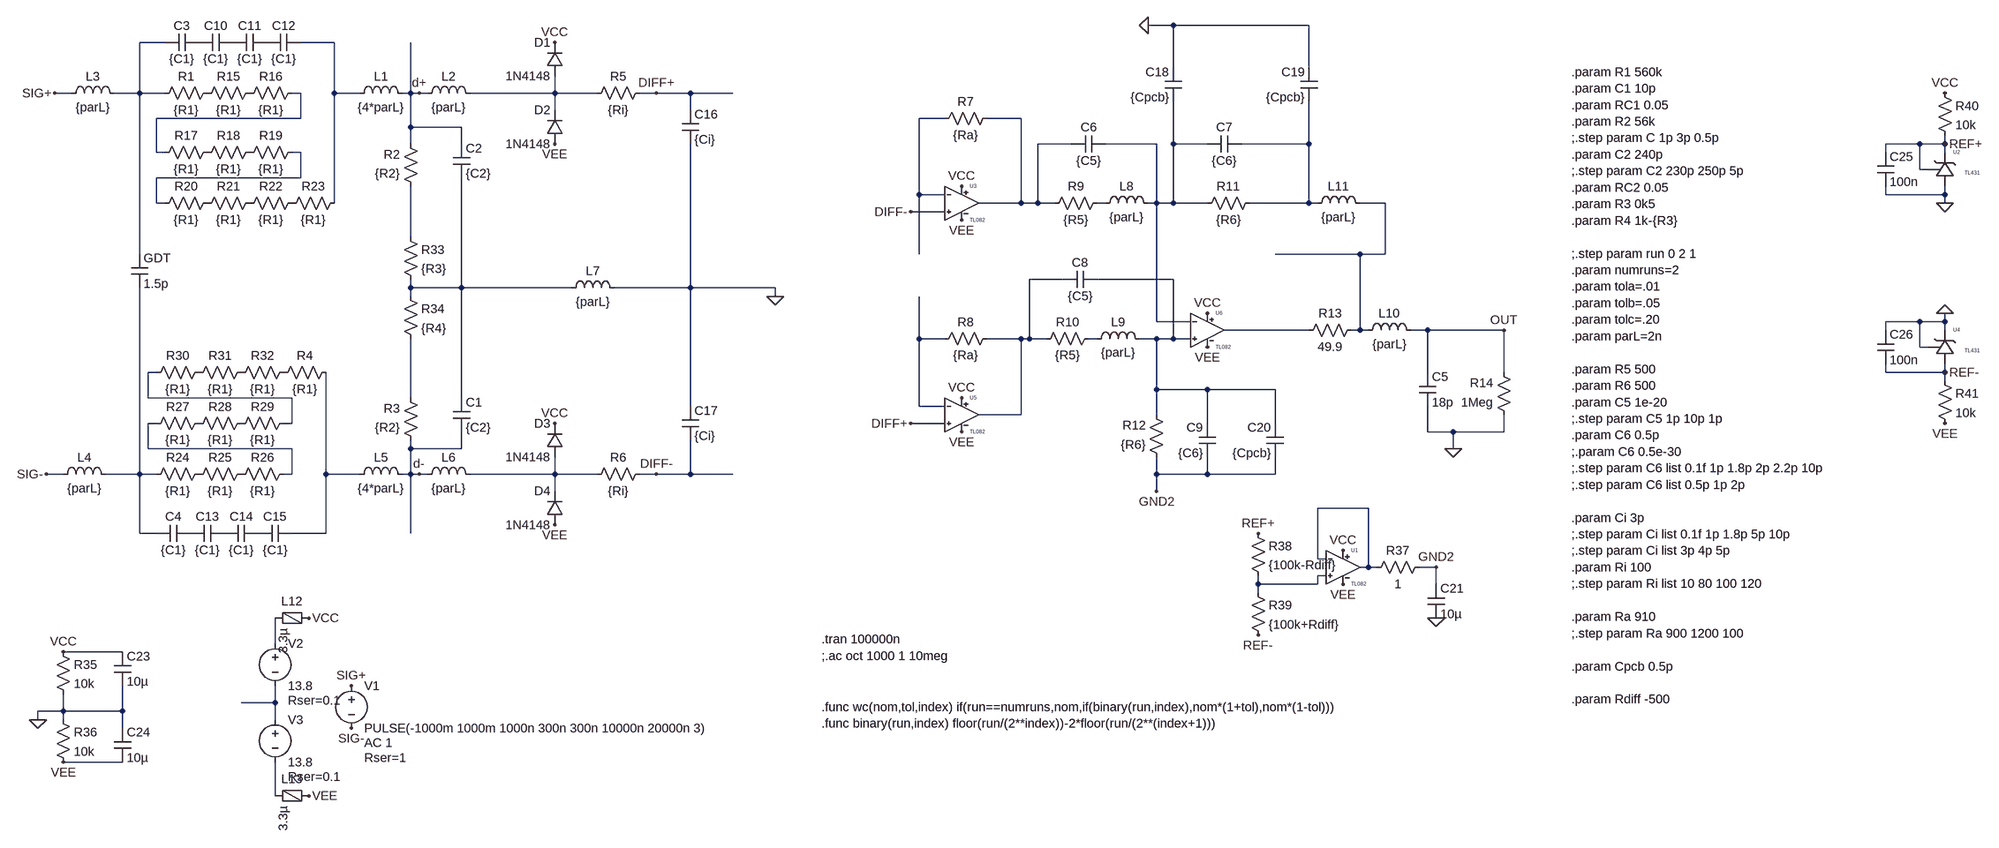
[diagram p0: schematic differential_probe_7_real_tl082.asc]
differential_probe_7_real_tl082.asc, the LTspice schematic file:
Version 4
SHEET 1 2708 2004
WIRE 992 -176 944 -176
WIRE 1248 -176 992 -176
WIRE -912 -144 -960 -144
WIRE -592 -144 -656 -144
WIRE 992 -96 992 -176
WIRE 1248 -96 1248 -176
WIRE -1088 -48 -1120 -48
WIRE -960 -48 -960 -144
WIRE -960 -48 -1008 -48
WIRE -912 -48 -960 -48
WIRE -656 -48 -672 -48
WIRE -592 -48 -592 -144
WIRE -544 -48 -592 -48
WIRE -448 -48 -448 -144
WIRE -448 -48 -464 -48
WIRE -432 -48 -448 -48
WIRE -416 -48 -432 -48
WIRE -176 -48 -176 -80
WIRE -176 -48 -336 -48
WIRE -96 -48 -176 -48
WIRE 16 -48 -16 -48
WIRE 80 -48 16 -48
WIRE 160 -48 80 -48
WIRE -176 -16 -176 -48
WIRE 80 -16 80 -48
WIRE -656 0 -656 -48
WIRE -656 0 -928 0
WIRE 560 0 512 0
WIRE 704 0 640 0
WIRE -448 16 -448 -48
WIRE -352 16 -448 16
WIRE -448 48 -448 16
WIRE -352 48 -352 16
WIRE 800 48 736 48
WIRE 960 48 864 48
WIRE 992 48 992 -32
WIRE 1056 48 992 48
WIRE 1248 48 1248 -32
WIRE 1248 48 1120 48
WIRE 2464 48 2400 48
WIRE 2512 48 2512 32
WIRE 2512 48 2464 48
WIRE -928 64 -928 0
WIRE -912 64 -928 64
WIRE -656 64 -672 64
WIRE 2400 64 2400 48
WIRE 2512 64 2512 48
WIRE 2464 96 2464 48
WIRE 2480 96 2464 96
WIRE -656 112 -656 64
WIRE -656 112 -928 112
WIRE 512 144 512 0
WIRE 560 144 512 144
WIRE 2400 144 2400 128
WIRE 2512 144 2512 128
WIRE 2512 144 2400 144
WIRE -928 160 -928 112
WIRE -912 160 -928 160
WIRE -592 160 -592 -48
WIRE 704 160 704 0
WIRE 704 160 624 160
WIRE 736 160 736 48
WIRE 736 160 704 160
WIRE 768 160 736 160
WIRE 864 160 848 160
WIRE 960 160 960 48
WIRE 960 160 944 160
WIRE 992 160 992 48
WIRE 992 160 960 160
WIRE 1056 160 992 160
WIRE 1248 160 1248 48
WIRE 1248 160 1136 160
WIRE 1264 160 1248 160
WIRE 1392 160 1344 160
WIRE 2512 160 2512 144
WIRE 560 176 496 176
WIRE -448 224 -448 128
WIRE -960 256 -960 -48
WIRE 512 256 512 144
WIRE 1344 256 1184 256
WIRE 1392 256 1392 160
WIRE 1392 256 1344 256
WIRE 784 304 720 304
WIRE 992 304 848 304
WIRE -448 320 -448 304
WIRE -352 320 -352 112
WIRE -352 320 -448 320
WIRE -144 320 -352 320
WIRE 80 320 80 48
WIRE 80 320 -64 320
WIRE 240 320 80 320
WIRE -448 336 -448 320
WIRE 240 336 240 320
WIRE 960 384 960 160
WIRE 1024 384 960 384
WIRE 2464 384 2400 384
WIRE 2512 384 2512 368
WIRE 2512 384 2464 384
WIRE 1248 400 1088 400
WIRE 1344 400 1344 256
WIRE 1344 400 1328 400
WIRE 1360 400 1344 400
WIRE 1472 400 1440 400
WIRE 1616 400 1472 400
WIRE 2400 400 2400 384
WIRE 2512 400 2512 384
WIRE 512 416 512 336
WIRE 560 416 512 416
WIRE 704 416 640 416
WIRE 720 416 720 304
WIRE 720 416 704 416
WIRE 752 416 720 416
WIRE 848 416 832 416
WIRE 960 416 928 416
WIRE 992 416 992 304
WIRE 992 416 960 416
WIRE 1024 416 992 416
WIRE 2464 432 2464 384
WIRE 2480 432 2464 432
WIRE -928 480 -944 480
WIRE 1472 480 1472 400
WIRE 1616 480 1616 400
WIRE 2400 480 2400 464
WIRE 2512 480 2512 464
WIRE 2512 480 2400 480
WIRE 2512 496 2512 480
WIRE 960 512 960 416
WIRE 1056 512 960 512
WIRE 1184 512 1056 512
WIRE -944 528 -944 480
WIRE -672 528 -944 528
WIRE -448 528 -448 416
WIRE -352 528 -352 320
WIRE 80 544 80 320
WIRE 512 544 512 416
WIRE 560 544 512 544
WIRE 704 560 704 416
WIRE 704 560 624 560
WIRE 960 560 960 512
WIRE -928 576 -944 576
WIRE -672 576 -672 528
WIRE -672 576 -688 576
WIRE 560 576 496 576
WIRE 1056 576 1056 512
WIRE 1184 576 1184 512
WIRE 1472 592 1472 544
WIRE 1520 592 1472 592
WIRE 1616 592 1616 560
WIRE 1616 592 1520 592
WIRE -944 624 -944 576
WIRE -672 624 -944 624
WIRE -448 624 -448 608
WIRE -352 624 -352 592
WIRE -352 624 -448 624
WIRE 1520 624 1520 592
WIRE -1104 672 -1136 672
WIRE -960 672 -960 320
WIRE -960 672 -1024 672
WIRE -928 672 -960 672
WIRE -672 672 -672 624
WIRE -672 672 -688 672
WIRE -608 672 -608 480
WIRE -544 672 -608 672
WIRE -448 672 -448 624
WIRE -448 672 -464 672
WIRE -432 672 -448 672
WIRE -416 672 -432 672
WIRE -176 672 -176 640
WIRE -176 672 -336 672
WIRE -96 672 -176 672
WIRE 16 672 -16 672
WIRE 80 672 80 608
WIRE 80 672 16 672
WIRE 160 672 80 672
WIRE 960 672 960 640
WIRE 1056 672 1056 640
WIRE 1056 672 960 672
WIRE 1184 672 1184 640
WIRE 1184 672 1056 672
WIRE -176 704 -176 672
WIRE 960 704 960 672
WIRE 1360 736 1264 736
WIRE -960 784 -960 672
WIRE -928 784 -960 784
WIRE -608 784 -608 672
WIRE -608 784 -672 784
WIRE -448 784 -448 672
WIRE 1264 832 1264 736
WIRE 1280 832 1264 832
WIRE 1360 848 1360 736
WIRE 1360 848 1344 848
WIRE 1376 848 1360 848
WIRE 1488 848 1456 848
WIRE 1280 864 1264 864
WIRE 1152 880 1152 864
WIRE 1264 880 1264 864
WIRE 1264 880 1152 880
WIRE 1488 880 1488 848
WIRE 1152 896 1152 880
WIRE -704 992 -704 944
WIRE -992 1008 -1104 1008
WIRE -704 1104 -704 1072
WIRE -704 1104 -768 1104
WIRE -1104 1120 -1104 1088
WIRE -1104 1120 -1152 1120
WIRE -992 1120 -992 1072
WIRE -992 1120 -1104 1120
WIRE -1152 1136 -1152 1120
WIRE -1104 1136 -1104 1120
WIRE -704 1136 -704 1104
WIRE -992 1152 -992 1120
WIRE -992 1216 -1104 1216
WIRE -704 1280 -704 1216
FLAG 240 336 0
FLAG -1120 -48 SIG+
FLAG -1136 672 SIG-
FLAG 16 -48 DIFF+
FLAG 16 672 DIFF-
FLAG -560 1072 SIG+
FLAG -560 1152 SIG-
FLAG -1152 1136 0
FLAG -640 944 VCC
FLAG -640 1280 VEE
FLAG 592 128 VCC
FLAG 592 528 VCC
FLAG 592 192 VEE
FLAG 592 592 VEE
FLAG 1056 432 VEE
FLAG 1056 368 VCC
FLAG 1488 944 0
FLAG 1520 624 0
FLAG 1616 400 OUT
FLAG -176 48 VEE
FLAG -176 -144 VCC
FLAG -176 768 VEE
FLAG -176 576 VCC
FLAG 496 576 DIFF+
FLAG 496 176 DIFF-
FLAG -432 -48 d+
FLAG -432 672 d-
FLAG -1104 1008 VCC
FLAG -1104 1216 VEE
FLAG 944 -176 0
FLAG 1312 816 VCC
FLAG 1152 784 REF+
FLAG 1312 880 VEE
FLAG 1152 976 REF-
FLAG 1488 848 GND2
FLAG 960 704 GND2
FLAG 2512 160 0
FLAG 2512 -48 VCC
FLAG 2512 48 REF+
FLAG 2512 368 0
FLAG 2512 576 VEE
FLAG 2512 480 REF-
SYMBOL res -816 -64 R90
WINDOW 0 0 56 VBottom 2
WINDOW 3 32 56 VTop 2
SYMATTR InstName R1
SYMATTR Value {R1}
SYMBOL res -432 144 R180
WINDOW 0 36 76 Left 2
WINDOW 3 36 40 Left 2
SYMATTR InstName R2
SYMATTR Value {R2}
SYMBOL res -432 624 R180
WINDOW 0 36 76 Left 2
WINDOW 3 36 40 Left 2
SYMATTR InstName R3
SYMATTR Value {R2}
SYMBOL cap -368 528 R0
SYMATTR InstName C1
SYMATTR Value {C2}
SYMATTR SpiceLine Rser={RC2}
SYMBOL cap -368 48 R0
SYMATTR InstName C2
SYMATTR Value {C2}
SYMATTR SpiceLine Rser={RC2}
SYMBOL cap -848 -160 R90
WINDOW 0 0 32 VBottom 2
WINDOW 3 32 32 VTop 2
SYMATTR InstName C3
SYMATTR Value {C1}
SYMATTR SpiceLine Rser={RC1}
SYMBOL res 0 -64 R90
WINDOW 0 0 56 VBottom 2
WINDOW 3 32 56 VTop 2
SYMATTR InstName R5
SYMATTR Value {Ri}
SYMBOL res 0 656 R90
WINDOW 0 0 56 VBottom 2
WINDOW 3 32 56 VTop 2
SYMATTR InstName R6
SYMATTR Value {Ri}
SYMBOL voltage -560 1056 R0
WINDOW 123 24 124 Left 2
WINDOW 39 24 152 Left 2
SYMATTR Value2 AC 1
SYMATTR SpiceLine Rser=1
SYMATTR InstName V1
SYMATTR Value PULSE(-1000m 1000m 1000n 300n 300n 10000n 20000n 3)
SYMBOL voltage -704 976 R0
WINDOW 123 0 0 Left 0
WINDOW 39 24 124 Left 2
SYMATTR SpiceLine Rser=0.1
SYMATTR InstName V2
SYMATTR Value 13.8
SYMBOL voltage -704 1120 R0
WINDOW 123 0 0 Left 0
WINDOW 39 24 124 Left 2
SYMATTR SpiceLine Rser=0.1
SYMATTR InstName V3
SYMATTR Value 13.8
SYMBOL res 656 -16 R90
WINDOW 0 0 56 VBottom 2
WINDOW 3 32 56 VTop 2
SYMATTR InstName R7
SYMATTR Value {Ra}
SYMBOL res 656 400 R90
WINDOW 0 0 56 VBottom 2
WINDOW 3 32 56 VTop 2
SYMATTR InstName R8
SYMATTR Value {Ra}
SYMBOL res 864 144 R90
WINDOW 0 0 56 VBottom 2
WINDOW 3 32 56 VTop 2
SYMATTR InstName R9
SYMATTR Value {R5}
SYMBOL res 848 400 R90
WINDOW 0 0 56 VBottom 2
WINDOW 3 32 56 VTop 2
SYMATTR InstName R10
SYMATTR Value {R5}
SYMBOL res 1152 144 R90
WINDOW 0 0 56 VBottom 2
WINDOW 3 32 56 VTop 2
SYMATTR InstName R11
SYMATTR Value {R6}
SYMBOL res 976 656 R180
WINDOW 0 36 76 Left 2
WINDOW 3 36 40 Left 2
SYMATTR InstName R12
SYMATTR Value {R6}
SYMBOL res 1344 384 R90
WINDOW 0 0 56 VBottom 2
WINDOW 3 32 56 VTop 2
SYMATTR InstName R13
SYMATTR Value 49.9
SYMBOL res 1632 576 R180
WINDOW 0 36 76 Left 2
WINDOW 3 36 40 Left 2
SYMATTR InstName R14
SYMATTR Value 1Meg
SYMBOL cap 1456 480 R0
SYMATTR InstName C5
SYMATTR Value 18p
SYMBOL diode -160 -80 R180
WINDOW 0 24 64 Left 2
WINDOW 3 24 0 Left 2
SYMATTR InstName D1
SYMATTR Value 1N4148
SYMBOL diode -160 48 R180
WINDOW 0 24 64 Left 2
WINDOW 3 24 0 Left 2
SYMATTR InstName D2
SYMATTR Value 1N4148
SYMBOL diode -160 640 R180
WINDOW 0 24 64 Left 2
WINDOW 3 24 0 Left 2
SYMATTR InstName D3
SYMATTR Value 1N4148
SYMBOL diode -160 768 R180
WINDOW 0 24 64 Left 2
WINDOW 3 24 0 Left 2
SYMATTR InstName D4
SYMATTR Value 1N4148
SYMBOL ind -560 -32 R270
WINDOW 0 32 56 VTop 2
WINDOW 3 5 56 VBottom 2
SYMATTR InstName L1
SYMATTR Value {4*parL}
SYMBOL ind -432 -32 R270
WINDOW 0 32 56 VTop 2
WINDOW 3 5 56 VBottom 2
SYMATTR InstName L2
SYMATTR Value {parL}
SYMBOL ind -1104 -32 R270
WINDOW 0 32 56 VTop 2
WINDOW 3 5 56 VBottom 2
SYMATTR InstName L3
SYMATTR Value {parL}
SYMBOL ind -1120 688 R270
WINDOW 0 32 56 VTop 2
WINDOW 3 5 56 VBottom 2
SYMATTR InstName L4
SYMATTR Value {parL}
SYMBOL ind -560 688 R270
WINDOW 0 32 56 VTop 2
WINDOW 3 5 56 VBottom 2
SYMATTR InstName L5
SYMATTR Value {4*parL}
SYMBOL ind -432 688 R270
WINDOW 0 32 56 VTop 2
WINDOW 3 5 56 VBottom 2
SYMATTR InstName L6
SYMATTR Value {parL}
SYMBOL ind -160 336 R270
WINDOW 0 32 56 VTop 2
WINDOW 3 5 56 VBottom 2
SYMATTR InstName L7
SYMATTR Value {parL}
SYMBOL ind 848 176 R270
WINDOW 0 32 56 VTop 2
WINDOW 3 5 56 VBottom 2
SYMATTR InstName L8
SYMATTR Value {parL}
SYMBOL ind 832 432 R270
WINDOW 0 32 56 VTop 2
WINDOW 3 5 56 VBottom 2
SYMATTR InstName L9
SYMATTR Value {parL}
SYMBOL ind 1344 416 R270
WINDOW 0 32 56 VTop 2
WINDOW 3 5 56 VBottom 2
SYMATTR InstName L10
SYMATTR Value {parL}
SYMBOL ind 1248 176 R270
WINDOW 0 32 56 VTop 2
WINDOW 3 5 56 VBottom 2
SYMATTR InstName L11
SYMATTR Value {parL}
SYMBOL cap 864 32 R90
WINDOW 0 0 32 VBottom 2
WINDOW 3 32 32 VTop 2
SYMATTR InstName C6
SYMATTR Value {C5}
SYMBOL cap 1120 32 R90
WINDOW 0 0 32 VBottom 2
WINDOW 3 32 32 VTop 2
SYMATTR InstName C7
SYMATTR Value {C6}
SYMATTR SpiceLine Rser=0.01
SYMBOL cap 848 288 R90
WINDOW 0 0 32 VBottom 2
WINDOW 3 32 32 VTop 2
SYMATTR InstName C8
SYMATTR Value {C5}
SYMBOL cap 1072 640 R180
WINDOW 0 24 56 Left 2
WINDOW 3 24 8 Left 2
SYMATTR InstName C9
SYMATTR Value {C6}
SYMATTR SpiceLine Rser=0.01
SYMBOL res -736 -64 R90
WINDOW 0 0 56 VBottom 2
WINDOW 3 32 56 VTop 2
SYMATTR InstName R15
SYMATTR Value {R1}
SYMBOL res -656 -64 R90
WINDOW 0 0 56 VBottom 2
WINDOW 3 32 56 VTop 2
SYMATTR InstName R16
SYMATTR Value {R1}
SYMBOL res -816 48 R90
WINDOW 0 0 56 VBottom 2
WINDOW 3 32 56 VTop 2
SYMATTR InstName R17
SYMATTR Value {R1}
SYMBOL res -736 48 R90
WINDOW 0 0 56 VBottom 2
WINDOW 3 32 56 VTop 2
SYMATTR InstName R18
SYMATTR Value {R1}
SYMBOL res -656 48 R90
WINDOW 0 0 56 VBottom 2
WINDOW 3 32 56 VTop 2
SYMATTR InstName R19
SYMATTR Value {R1}
SYMBOL res -816 144 R90
WINDOW 0 0 56 VBottom 2
WINDOW 3 32 56 VTop 2
SYMATTR InstName R20
SYMATTR Value {R1}
SYMBOL res -736 144 R90
WINDOW 0 0 56 VBottom 2
WINDOW 3 32 56 VTop 2
SYMATTR InstName R21
SYMATTR Value {R1}
SYMBOL res -656 144 R90
WINDOW 0 0 56 VBottom 2
WINDOW 3 32 56 VTop 2
SYMATTR InstName R22
SYMATTR Value {R1}
SYMBOL res -576 144 R90
WINDOW 0 0 56 VBottom 2
WINDOW 3 32 56 VTop 2
SYMATTR InstName R23
SYMATTR Value {R1}
SYMBOL cap -784 -160 R90
WINDOW 0 0 32 VBottom 2
WINDOW 3 32 32 VTop 2
SYMATTR InstName C10
SYMATTR Value {C1}
SYMATTR SpiceLine Rser={RC1}
SYMBOL cap -720 -160 R90
WINDOW 0 0 32 VBottom 2
WINDOW 3 32 32 VTop 2
SYMATTR InstName C11
SYMATTR Value {C1}
SYMATTR SpiceLine Rser={RC1}
SYMBOL cap -656 -160 R90
WINDOW 0 0 32 VBottom 2
WINDOW 3 32 32 VTop 2
SYMATTR InstName C12
SYMATTR Value {C1}
SYMATTR SpiceLine Rser={RC1}
SYMBOL res -832 656 R90
WINDOW 0 0 56 VBottom 2
WINDOW 3 32 56 VTop 2
SYMATTR InstName R24
SYMATTR Value {R1}
SYMBOL res -752 656 R90
WINDOW 0 0 56 VBottom 2
WINDOW 3 32 56 VTop 2
SYMATTR InstName R25
SYMATTR Value {R1}
SYMBOL res -672 656 R90
WINDOW 0 0 56 VBottom 2
WINDOW 3 32 56 VTop 2
SYMATTR InstName R26
SYMATTR Value {R1}
SYMBOL res -832 560 R90
WINDOW 0 0 56 VBottom 2
WINDOW 3 32 56 VTop 2
SYMATTR InstName R27
SYMATTR Value {R1}
SYMBOL res -752 560 R90
WINDOW 0 0 56 VBottom 2
WINDOW 3 32 56 VTop 2
SYMATTR InstName R28
SYMATTR Value {R1}
SYMBOL res -672 560 R90
WINDOW 0 0 56 VBottom 2
WINDOW 3 32 56 VTop 2
SYMATTR InstName R29
SYMATTR Value {R1}
SYMBOL res -832 464 R90
WINDOW 0 0 56 VBottom 2
WINDOW 3 32 56 VTop 2
SYMATTR InstName R30
SYMATTR Value {R1}
SYMBOL res -752 464 R90
WINDOW 0 0 56 VBottom 2
WINDOW 3 32 56 VTop 2
SYMATTR InstName R31
SYMATTR Value {R1}
SYMBOL res -672 464 R90
WINDOW 0 0 56 VBottom 2
WINDOW 3 32 56 VTop 2
SYMATTR InstName R32
SYMATTR Value {R1}
SYMBOL res -592 464 R90
WINDOW 0 0 56 VBottom 2
WINDOW 3 32 56 VTop 2
SYMATTR InstName R4
SYMATTR Value {R1}
SYMBOL cap -864 768 R90
WINDOW 0 0 32 VBottom 2
WINDOW 3 32 32 VTop 2
SYMATTR InstName C4
SYMATTR Value {C1}
SYMATTR SpiceLine Rser={RC1}
SYMBOL cap -800 768 R90
WINDOW 0 0 32 VBottom 2
WINDOW 3 32 32 VTop 2
SYMATTR InstName C13
SYMATTR Value {C1}
SYMATTR SpiceLine Rser={RC1}
SYMBOL cap -736 768 R90
WINDOW 0 0 32 VBottom 2
WINDOW 3 32 32 VTop 2
SYMATTR InstName C14
SYMATTR Value {C1}
SYMATTR SpiceLine Rser={RC1}
SYMBOL cap -672 768 R90
WINDOW 0 0 32 VBottom 2
WINDOW 3 32 32 VTop 2
SYMATTR InstName C15
SYMATTR Value {C1}
SYMATTR SpiceLine Rser={RC1}
SYMBOL res -464 208 R0
SYMATTR InstName R33
SYMATTR Value {R3}
SYMBOL res -464 320 R0
SYMATTR InstName R34
SYMATTR Value {R4}
SYMBOL cap 64 -16 R0
SYMATTR InstName C16
SYMATTR Value {Ci}
SYMBOL cap 64 544 R0
SYMATTR InstName C17
SYMATTR Value {Ci}
SYMBOL cap -976 256 R0
SYMATTR InstName GDT
SYMATTR Value 1.5p
SYMBOL res -1120 992 R0
SYMATTR InstName R35
SYMATTR Value 10k
SYMBOL res -1120 1120 R0
SYMATTR InstName R36
SYMATTR Value 10k
SYMBOL cap 1008 -32 R180
WINDOW 0 24 56 Left 2
WINDOW 3 24 8 Left 2
SYMATTR InstName C18
SYMATTR Value {Cpcb}
SYMATTR SpiceLine Rser=0.01
SYMBOL cap 1264 -32 R180
WINDOW 0 24 56 Left 2
WINDOW 3 24 8 Left 2
SYMATTR InstName C19
SYMATTR Value {Cpcb}
SYMATTR SpiceLine Rser=0.01
SYMBOL cap 1200 640 R180
WINDOW 0 24 56 Left 2
WINDOW 3 24 8 Left 2
SYMATTR InstName C20
SYMATTR Value {Cpcb}
SYMATTR SpiceLine Rser=0.01
SYMBOL FerriteBead -672 944 R90
WINDOW 0 -16 0 VBottom 2
SYMATTR InstName L12
SYMATTR Value 3.3µ
SYMATTR SpiceLine Ipk=0.6 Rser=0.23 Rpar=1050 Cpar=680f mfg="Würth Elektronik" pn="742792662 WE-CBF 0603"
SYMBOL FerriteBead -672 1280 R90
WINDOW 0 -16 0 VBottom 2
SYMATTR InstName L13
SYMATTR Value 3.3µ
SYMATTR SpiceLine Ipk=0.6 Rser=0.23 Rpar=1050 Cpar=680f mfg="Würth Elektronik" pn="742792662 WE-CBF 0603"
SYMBOL TL082 592 96 R0
SYMATTR InstName U3
SYMBOL TL082 592 496 R0
SYMATTR InstName U5
SYMBOL TL082 1056 336 R0
SYMATTR InstName U6
SYMBOL TL082 1312 784 R0
SYMATTR InstName U1
SYMBOL cap 1472 880 R0
SYMATTR InstName C21
SYMATTR Value 10µ
SYMBOL res 1472 832 R90
WINDOW 0 0 56 VBottom 2
WINDOW 3 32 56 VTop 2
SYMATTR InstName R37
SYMATTR Value 1
SYMBOL res 1136 768 R0
SYMATTR InstName R38
SYMATTR Value {100k-Rdiff}
SYMBOL res 1136 880 R0
SYMATTR InstName R39
SYMATTR Value {100k+Rdiff}
SYMBOL cap -1008 1008 R0
SYMATTR InstName C23
SYMATTR Value 10µ
SYMATTR SpiceLine V=25 Irms=0 Rser=0 Lser=0 mfg="Murata" pn="GRM188R61E106MA73" type="X5R"
SYMBOL cap -1008 1152 R0
SYMATTR InstName C24
SYMATTR Value 10µ
SYMATTR SpiceLine V=25 Irms=0 Rser=0 Lser=0 mfg="Murata" pn="GRM188R61E106MA73" type="X5R"
SYMBOL TL431 2496 64 R0
SYMATTR InstName U2
SYMBOL res 2496 -64 R0
SYMATTR InstName R40
SYMATTR Value 10k
SYMBOL cap 2384 64 R0
SYMATTR InstName C25
SYMATTR Value 100n
SYMBOL TL431 2496 400 R0
SYMATTR InstName U4
SYMBOL res 2496 480 R0
SYMATTR InstName R41
SYMATTR Value 10k
SYMBOL cap 2384 400 R0
SYMATTR InstName C26
SYMATTR Value 100n
TEXT 328 984 Left 2 !.tran 100000n\n;.ac oct 1000 1 10meg
TEXT 328 1112 Left 2 !.func wc(nom,tol,index) if(run==numruns,nom,if(binary(run,index),nom*(1+tol),nom*(1-tol)))\n.func binary(run,index) floor(run/(2**index))-2*floor(run/(2**(index+1)))
TEXT 1752 -88 Left 2 !.param R1 560k\n.param C1 10p\n.param RC1 0.05\n.param R2 56k\n;.step param C 1p 3p 0.5p\n.param C2 240p\n;.step param C2 230p 250p 5p\n.param RC2 0.05\n.param R3 0k5\n.param R4 1k-{R3}\n \n;.step param run 0 2 1\n.param numruns=2\n.param tola=.01\n.param tolb=.05\n.param tolc=.20\n.param parL=2n\n \n.param R5 500\n.param R6 500\n.param C5 1e-20\n;.step param C5 1p 10p 1p\n.param C6 0.5p\n;.param C6 0.5e-30\n;.step param C6 list 0.1f 1p 1.8p 2p 2.2p 10p\n;.step param C6 list 0.5p 1p 2p\n \n.param Ci 3p \n;.step param Ci list 0.1f 1p 1.8p 5p 10p\n;.step param Ci list 3p 4p 5p\n.param Ri 100\n;.step param Ri list 10 80 100 120\n \n.param Ra 910\n;.step param Ra 900 1200 100\n \n.param Cpcb 0.5p\n \n.param Rdiff -500

The netlist it stands for:
* differential_probe_7_real_tl082.asc
R1 P001 N001 {R1}
R2 N012 d+ {R2}
R3 d- N020 {R2}
C1 N015 d- {C2} Rser={RC2}
C2 d+ N015 {C2} Rser={RC2}
C3 P002 N001 {C1} Rser={RC1}
R5 DIFF+ N004 {Ri}
R6 DIFF- N024 {Ri}
V1 SIG+ SIG- PULSE(-1000m 1000m 1000n 300n 300n 10000n 20000n 3) AC 1 Rser=1
V2 N027 N028 13.8 Rser=0.1
V3 N028 N029 13.8 Rser=0.1
R7 N006 N005 {Ra}
R8 N013 N017 {Ra}
R9 N010 N006 {R5}
R10 N018 N013 {R5}
R11 N008 N007 {R6}
R12 GND2 N014 {R6}
R13 N011 N016 49.9
R14 0 OUT 1Meg
C5 OUT 0 18p
D1 N004 VCC 1N4148
D2 VEE N004 1N4148
D3 N024 VCC 1N4148
D4 VEE N024 1N4148
L1 N002 d+ {4*parL}
L2 d+ N004 {parL}
L3 SIG+ N001 {parL}
L4 SIG- N022 {parL}
L5 N023 d- {4*parL}
L6 d- N024 {parL}
L7 N015 0 {parL}
L8 N010 N007 {parL}
L9 N018 N014 {parL}
L10 N011 OUT {parL}
L11 N008 N011 {parL}
C6 N007 N006 {C5}
C7 N008 N007 {C6} Rser=0.01
C8 N014 N013 {C5}
C9 GND2 N014 {C6} Rser=0.01
R15 P003 P001 {R1}
R16 N003 P003 {R1}
R17 P004 N003 {R1}
R18 P005 P004 {R1}
R19 N009 P005 {R1}
R20 P006 N009 {R1}
R21 P007 P006 {R1}
R22 P008 P007 {R1}
R23 N002 P008 {R1}
C10 P009 P002 {C1} Rser={RC1}
C11 P010 P009 {C1} Rser={RC1}
C12 N002 P010 {C1} Rser={RC1}
R24 P011 N022 {R1}
R25 P012 P011 {R1}
R26 N021 P012 {R1}
R27 P013 N021 {R1}
R28 P014 P013 {R1}
R29 N019 P014 {R1}
R30 P015 N019 {R1}
R31 P016 P015 {R1}
R32 P017 P016 {R1}
R4 N023 P017 {R1}
C4 P018 N022 {C1} Rser={RC1}
C13 P019 P018 {C1} Rser={RC1}
C14 P020 P019 {C1} Rser={RC1}
C15 N023 P020 {C1} Rser={RC1}
R33 N012 N015 {R3}
R34 N015 N020 {R4}
C16 DIFF+ 0 {Ci}
C17 0 DIFF- {Ci}
C§GDT N001 N022 1.5p
R35 VCC 0 10k
R36 0 VEE 10k
C18 N007 0 {Cpcb} Rser=0.01
C19 N008 0 {Cpcb} Rser=0.01
C20 GND2 N014 {Cpcb} Rser=0.01
L12 VCC N027 3.3µ Ipk=0.6 Rser=0.23 Rpar=1050 Cpar=680f mfg="Würth Elektronik" pn="742792662 WE-CBF 0603"
L13 VEE N029 3.3µ Ipk=0.6 Rser=0.23 Rpar=1050 Cpar=680f mfg="Würth Elektronik" pn="742792662 WE-CBF 0603"
XU3 DIFF- N005 VCC VEE N006 TL082  ; pins IN+ IN- VCC VEE OUT
XU5 DIFF+ N017 VCC VEE N013 TL082  ; pins IN+ IN- VCC VEE OUT
XU6 N014 N007 VCC VEE N016 TL082  ; pins IN+ IN- VCC VEE OUT
XU1 N026 N025 VCC VEE N025 TL082  ; pins IN+ IN- VCC VEE OUT
C21 GND2 0 10µ
R37 GND2 N025 1
R38 REF+ N026 {100k-Rdiff}
R39 N026 REF- {100k+Rdiff}
C23 VCC 0 10µ V=25 Irms=0 Rser=0 Lser=0 mfg="Murata" pn="GRM188R61E106MA73" type="X5R"
C24 0 VEE 10µ V=25 Irms=0 Rser=0 Lser=0 mfg="Murata" pn="GRM188R61E106MA73" type="X5R"
XU2 0 REF+ REF+ TL431  ; pins A K R
R40 VCC REF+ 10k
C25 REF+ 0 100n
XU4 REF- 0 0 TL431  ; pins A K R
R41 REF- VEE 10k
C26 0 REF- 100n
.model D D
.lib standard.dio
.tran 100000n
;.ac oct 1000 1 10meg
.func wc(nom,tol,index) if(run==numruns,nom,if(binary(run,index),nom*(1+tol),nom*(1-tol)))
.func binary(run,index) floor(run/(2**index))-2*floor(run/(2**(index+1)))
.param R1 560k
.param C1 10p
.param RC1 0.05
.param R2 56k
;.step param C 1p 3p 0.5p
.param C2 240p
;.step param C2 230p 250p 5p
.param RC2 0.05
.param R3 0k5
.param R4 1k-{R3}
;.step param run 0 2 1
.param numruns=2
.param tola=.01
.param tolb=.05
.param tolc=.20
.param parL=2n
.param R5 500
.param R6 500
.param C5 1e-20
;.step param C5 1p 10p 1p
.param C6 0.5p
;.param C6 0.5e-30
;.step param C6 list 0.1f 1p 1.8p 2p 2.2p 10p
;.step param C6 list 0.5p 1p 2p
.param Ci 3p
;.step param Ci list 0.1f 1p 1.8p 5p 10p
;.step param Ci list 3p 4p 5p
.param Ri 100
;.step param Ri list 10 80 100 120
.param Ra 910
;.step param Ra 900 1200 100
.param Cpcb 0.5p
.param Rdiff -500
.lib TL082.sub
.lib TL431.lib
.backanno
.end